# Altium project MAX4906.PrjPcb
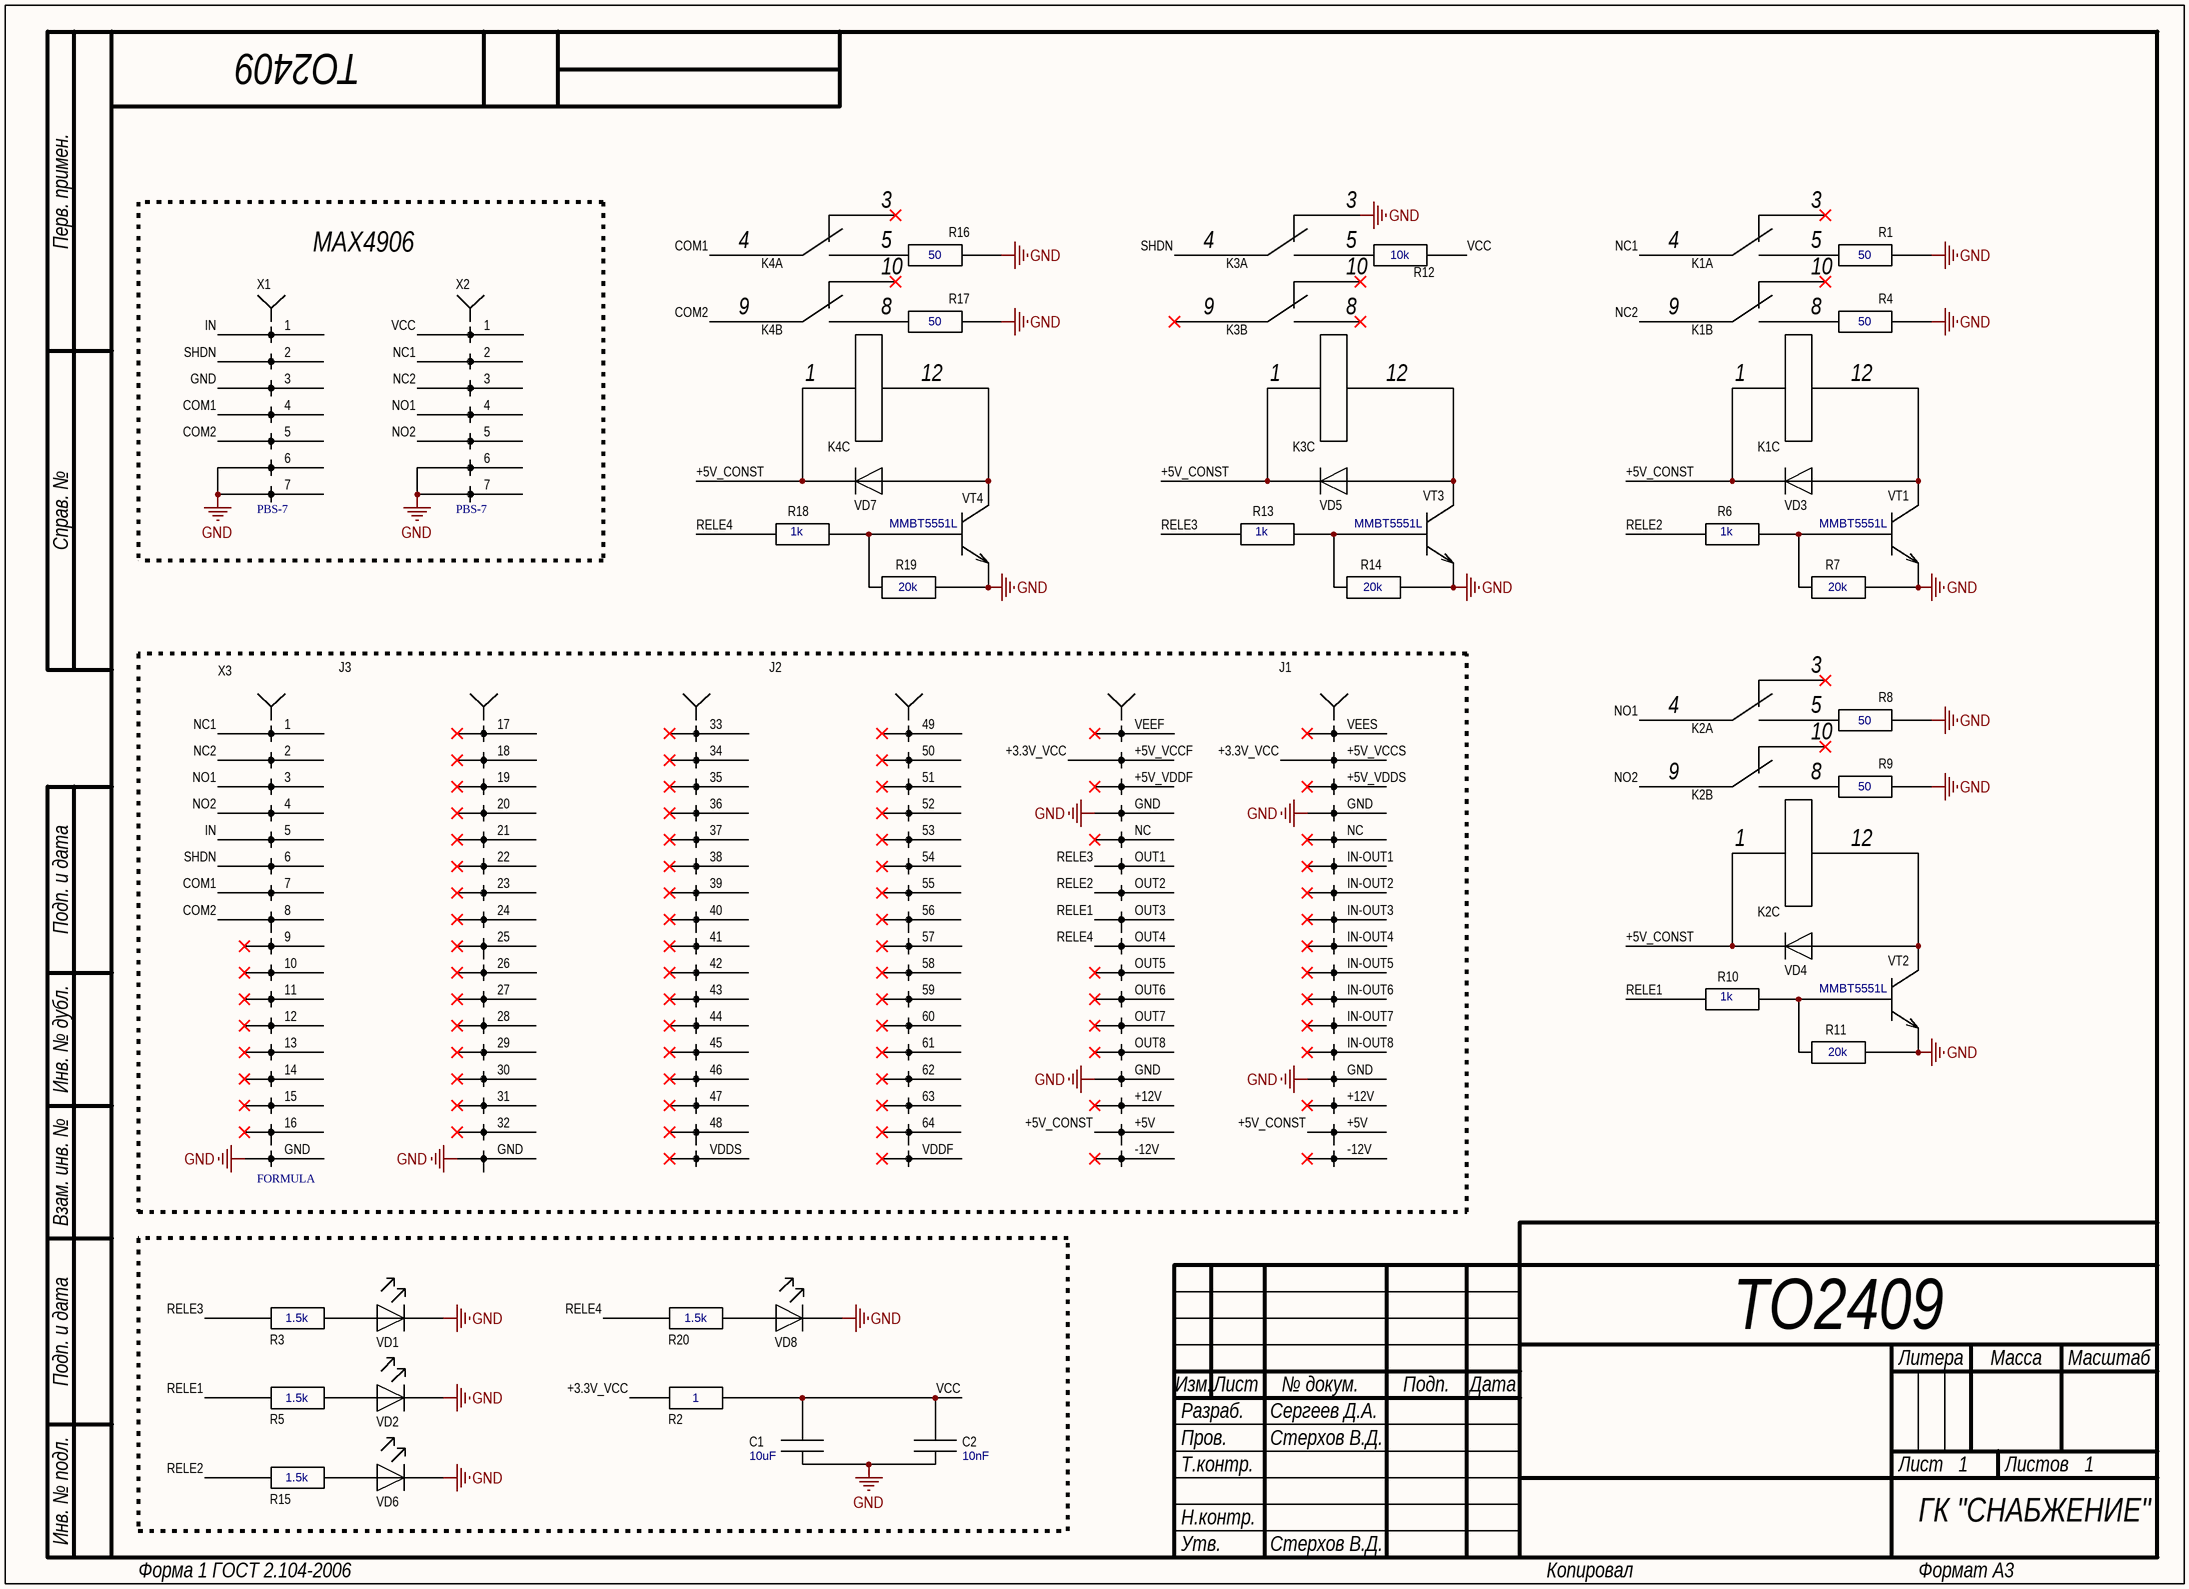
[diagram p0: Sheet1.SchDoc]
1 sheet, 41 parts. Net scope: global (net labels, ports and power ports of the same name join across sheets).
Board file: PCB1.PcbDoc

## Sheet Sheet1.SchDoc: ТО2409
size 410 x 297 mm; ApprovedBy: Стерхов В.Д.; CheckedBy: Стерхов В.Д.; Author: Сергеев Д.А.; CompanyName: ГК "СНАБЖЕНИЕ"; DrawnBy: Сергеев Д.А.; Engineer: Сергеев Д.А.; Organization: ГК "СНАБЖЕНИЕ"; DocumentNumber: ТО2409; Revision: 1; SheetNumber: 1; SheetTotal: 1

### Parts
C1  10uF  [0805]
C2  10nF  [0805]
K1  V23079A1001B301 TE  [V23079A1001B301]  (value not drawn)  (parts A,B,C of 3)
K2  V23079A1001B301 TE  [V23079A1001B301]  (value not drawn)  (parts A,B,C of 3)
K3  V23079A1001B301 TE  [V23079A1001B301]  (value not drawn)  (parts A,B,C of 3)
K4  V23079A1001B301 TE  [V23079A1001B301]  (value not drawn)  (parts A,B,C of 3)
R1  50  [0805]
R2  1  [0805]
R3  1.5k  [0805]
R4  50  [0805]
R5  1.5k  [0805]
R6  1k  [0805]
R7  20k  [0805]
R8  50  [0805]
R9  50  [0805]
R10  1k  [0805]
R11  20k  [0805]
R12  10k  [0805]
R13  1k  [0805]
R14  20k  [0805]
R15  1.5k  [0805]
R16  50  [0805]
R17  50  [0805]
R18  1k  [0805]
R19  20k  [0805]
R20  1.5k  [0805]
VD1  LED(0805)  [0805(LED)]  (value not drawn)
VD2  LED(0805)  [0805(LED)]  (value not drawn)
VD3  LL4148 NXP  [SOD80C]  (value not drawn)
VD4  LL4148 NXP  [SOD80C]  (value not drawn)
VD5  LL4148 NXP  [SOD80C]  (value not drawn)
VD6  LED(0805)  [0805(LED)]  (value not drawn)
VD7  LL4148 NXP  [SOD80C]  (value not drawn)
VD8  LED(0805)  [0805(LED)]  (value not drawn)
VT1  MMBT5551L  [SOT-23]
VT2  MMBT5551L  [SOT-23]
VT3  MMBT5551L  [SOT-23]
VT4  MMBT5551L  [SOT-23]
X1  PBS-7  [PBS7-2.54]
X2  PBS-7  [PBS7-2.54]
X3  FORMULA  [FORMULA]

### Blocks framed on the sheet
MAX4906: X1 X2

### Nets
GND: C1.2 C2.2 K3.3 R1.2 R4.2 R7.2 R8.2 R9.2 R11.2 R14.2 R16.2 R17.2 R19.2 VD1.2(K) VD2.2(K) VD6.2(K) VD8.2(K) VT1.2(E) VT2.2(E) VT3.2(E) VT4.2(E) X1.3 X1.6 X1.7 X2.6 X2.7 X3.GND
+3.3V_VCC: R2.1 X3.+5V_VCCF(VCCF) X3.+5V_VCCS(VCCS)
+5V_CONST: K1.1 K2.1 K3.1 K4.1 VD3.2(K) VD4.2(K) VD5.2(K) VD7.2(K) X3.+5V
COM1: K4.4 X1.4 X3.7
COM2: K4.9 X1.5 X3.8
IN: X1.1 X3.5
NC1: K1.4 X2.2 X3.1
NC2: K1.9 X2.3 X3.2
NO1: K2.4 X2.4 X3.3
NO2: K2.9 X2.5 X3.4
RELE1: R5.1 R10.1 X3.OUT3
RELE2: R6.1 R15.1 X3.OUT2
RELE3: R3.1 R13.1 X3.OUT1
RELE4: R18.1 R20.1 X3.OUT4
SHDN: K3.4 X1.2 X3.6
VCC: C1.1 C2.1 R2.2 R12.2 X2.1
NetK1_5: K1.5 R1.1
NetK1_8: K1.8 R4.1
NetK1_12: K1.12 VD3.1(A) VT1.3(K)
NetK2_5: K2.5 R8.1
NetK2_8: K2.8 R9.1
NetK2_12: K2.12 VD4.1(A) VT2.3(K)
NetK3_5: K3.5 R12.1
NetK3_12: K3.12 VD5.1(A) VT3.3(K)
NetK4_5: K4.5 R16.1
NetK4_8: K4.8 R17.1
NetK4_12: K4.12 VD7.1(A) VT4.3(K)
NetR3_2: R3.2 VD1.1(A)
NetR5_2: R5.2 VD2.1(A)
NetR6_2: R6.2 R7.1 VT1.1(B)
NetR10_2: R10.2 R11.1 VT2.1(B)
NetR13_2: R13.2 R14.1 VT3.1(B)
NetR15_2: R15.2 VD6.1(A)
NetR18_2: R18.2 R19.1 VT4.1(B)
NetR20_2: R20.2 VD8.1(A)

Not connected (* = marked no-connect by the designer): K1 3* 10*; K2 3* 10*; K3 8* 9* 10*; K4 3* 10*; X3 9* 10* 11* 12* 13* 14* 15* 16* 17* 18* 19* 20* 21* 22* 23* 24* 25* 26* 27* 28* 29* 30* 31* 32* 33* 34* 35* 36(4)* 37(5)* 38* 39* 40* 41* 42* 43* 44* 45* 46* 47* 48* 49* 50* 51* 52* 53* 54* 55* 56* 57* 58* 59* 60* 61* 62* 63* 64* +5V_VDDF(VDDF)* +5V_VDDS(VDDS)* +12V* -12V* IN-OUT1* IN-OUT2* IN-OUT3* IN-OUT4* IN-OUT5* IN-OUT6* IN-OUT7* IN-OUT8* NC* OUT5* OUT6* OUT7* OUT8* VDDF* VDDS* VEEF* VEES*

### Notes on the sheet
- Перв. примен.
- Справ. №
- Подп. и дата
- Инв. № дубл.
- Взам. инв. №
- Разраб.
- Изм.
- Лист
- № докум.
- Подп.
- Дата
- Литера
- Масса
- Масштаб
- Пров.
- Т.контр.
- Листов
- Инв. № подл.
- Н.контр.
- Утв.
- Форма 1 ГОСТ 2.104-2006
- Копировал
- Формат А3

### Library data of the parts
C1 C2 = C0805: ComponentHeigt: 1.3; Firme: AVX; Leadform: SMD; KIND: Конденсатор; ClassName: *; Component Link: *; ComponentWeigt: *; Packaging: 0805; NN: *; Value: *
R1-R20 = R0805 Yageo: ComponentHeigt: 0.6; Firme: Yageo; Leadform: SMD; Kind: Резистор; ClassName: *; ComponentWeigt: *; Component Link: *; Packaging: 0805; NN: *; Value: *
VD1 VD2 VD6 VD8 = LED(0805): ComponentHeigt: 0.75; Leadform: в отверстия; Firme: Kingbright; NN: 24003000; KIND: Светодиод L-1154GD Kingbright; Component Link: *; ClassName: *
VD3-VD5 VD7 = LL4148 NXP: ComponentHeigt: 1.6; Leadform: SMD; NN: 24009301; KIND: Диод LL4148 NXP; Component Link: http://www.nxp.com; Packaging: SOD-80C; ClassName: *; Firme: NXP
VT1-VT4 = MMBT5551L: ComponentHeigt: 1.1; Firme: ONS; Leadform: SMD; NN: 24007468; KIND: Транзистор MMBT5551L*G ONS; ClassName: *; ComponentWeigt: *; Packaging: SOT-23